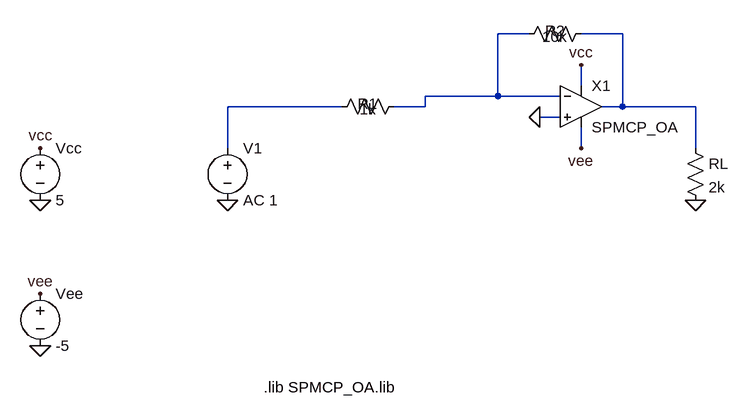
[diagram p0: schematic unseen_inverting.asc]
unseen_inverting.asc, the LTspice schematic file:
Version 4.1
SHEET 1 1600 1200
WIRE 112 0 -64 0
WIRE -64 0 -64 64
WIRE 512 0 544 0
WIRE 544 0 544 -112
WIRE 544 -112 480 -112
WIRE 656 64 656 0
WIRE 656 0 544 0
WIRE 448 -16 352 -16
WIRE 352 -16 240 -16
WIRE 240 -16 240 0
WIRE 240 0 192 0
WIRE 400 -112 352 -112
WIRE 352 -112 352 -16
WIRE 480 -32 480 -64
WIRE 480 32 480 64
WIRE 448 16 416 16
FLAG -352 64 vcc
FLAG -352 288 vee
FLAG 480 -64 vcc
FLAG 480 64 vee
FLAG -64 144 0
FLAG 416 16 0
FLAG 656 144 0
FLAG -352 144 0
FLAG -352 368 0
SYMBOL OpAmps\\opamp2 480 -64 R0
SYMATTR InstName X1
SYMATTR Value SPMCP_OA
SYMBOL res 96 16 R270
WINDOW 0 36 56 VBottom 2
WINDOW 3 -4 56 VTop 2
SYMATTR InstName R1
SYMATTR Value 1k
SYMBOL res 384 -96 R270
WINDOW 0 36 56 VBottom 2
WINDOW 3 -4 56 VTop 2
SYMATTR InstName R2
SYMATTR Value 10k
SYMBOL res 640 48 R0
SYMATTR InstName RL
SYMATTR Value 2k
SYMBOL voltage -64 48 R0
SYMATTR InstName V1
SYMATTR Value AC 1
SYMBOL voltage -352 48 R0
SYMATTR InstName Vcc
SYMATTR Value 5
SYMBOL voltage -352 272 R0
SYMATTR InstName Vee
SYMATTR Value -5
TEXT -8 432 Left 2 !.lib SPMCP_OA.lib

The netlist it stands for:
* unseen_inverting.asc
X§X1 0 N003 vcc vee N002 SPMCP_OA  ; pins In+ In- V+ V- OUT
R1 N001 N003 1k
R2 N003 N002 10k
RL N002 0 2k
V1 N001 0 AC 1
Vcc vcc 0 5
Vee vee 0 -5
.lib SPMCP_OA.lib
.backanno
.end